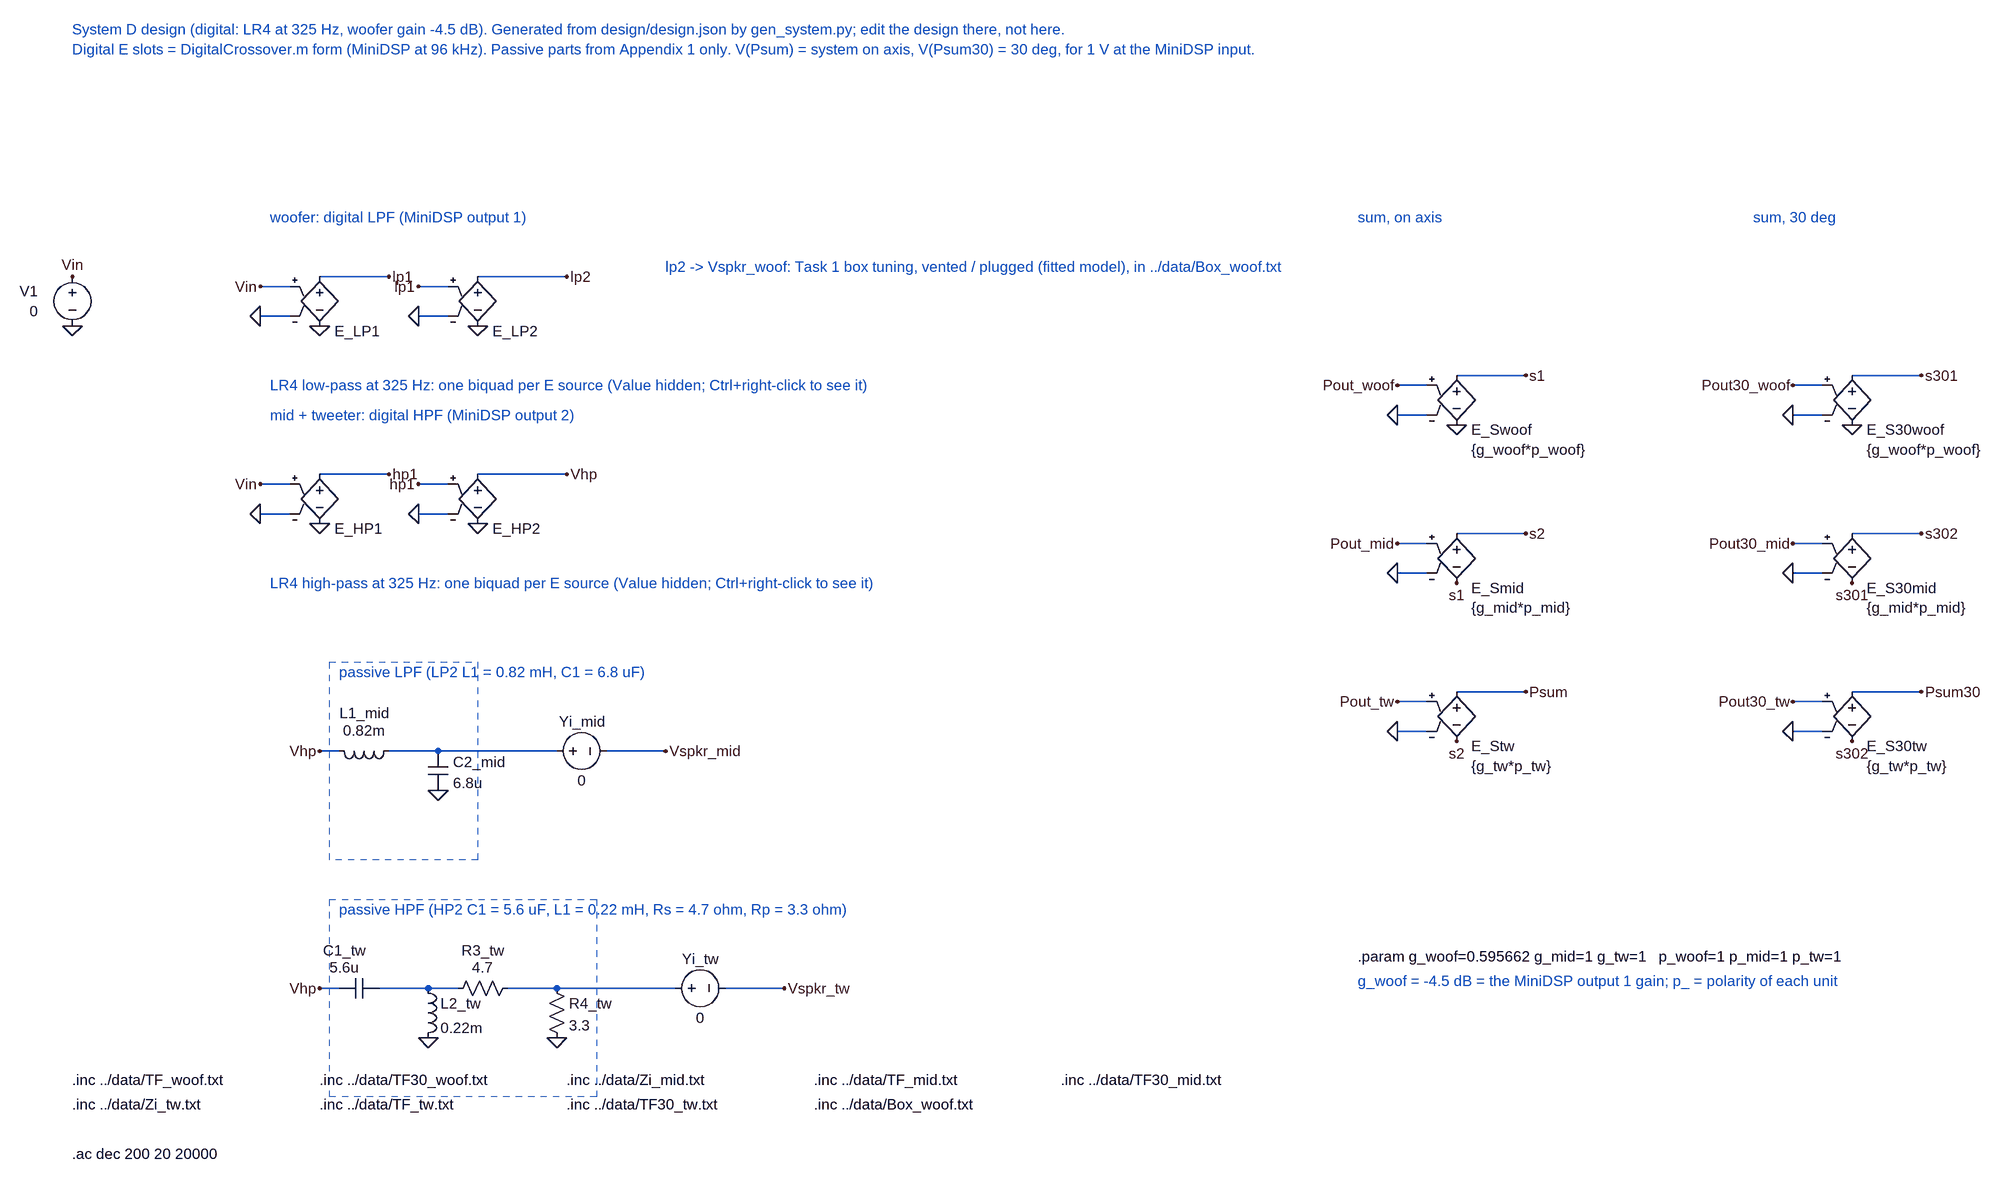
[diagram p0: schematic System_D_design.asc]
System_D_design.asc, the LTspice schematic file:
Version 4
SHEET 1 3200 1800
TEXT -400 -400 Left 2 ;System D design (digital: LR4 at 325 Hz, woofer gain -4.5 dB). Generated from design/design.json by gen_system.py; edit the design there, not here.
TEXT -400 -368 Left 2 ;Digital E slots = DigitalCrossover.m form (MiniDSP at 96 kHz). Passive parts from Appendix 1 only. V(Psum) = system on axis, V(Psum30) = 30 deg, for 1 V at the MiniDSP input.
SYMBOL voltage -400 -16 R0
WINDOW 0 -56 40 Right 2
WINDOW 3 -56 72 Right 2
SYMATTR InstName V1
SYMATTR Value 0
SYMATTR Value2 AC 1
FLAG -400 0 Vin
FLAG -400 80 0
TEXT -80 -96 Left 2 ;woofer: digital LPF (MiniDSP output 1)
SYMBOL e 0 -16 R0
WINDOW 0 24 104 Left 2
WINDOW 3 24 136 Invisible 2
SYMATTR InstName E_LP1
SYMATTR Value Laplace=(0.000111435745339139+0.000222871490678279*exp(-s*1.04166666666667e-05)+0.000111435745339139*exp(-2*s*1.04166666666667e-05))/(1+-1.96992019814112*exp(-s*1.04166666666667e-05)+0.970365941122475*exp(-2*s*1.04166666666667e-05))
FLAG 0 80 0
WIRE -48 16 -96 16
FLAG -96 16 Vin
WIRE -48 64 -96 64
FLAG -96 64 0
WIRE 0 0 112 0
FLAG 112 0 lp1
SYMBOL e 256 -16 R0
WINDOW 0 24 104 Left 2
WINDOW 3 24 136 Invisible 2
SYMATTR InstName E_LP2
SYMATTR Value Laplace=(0.000111435745339139+0.000222871490678279*exp(-s*1.04166666666667e-05)+0.000111435745339139*exp(-2*s*1.04166666666667e-05))/(1+-1.96992019814112*exp(-s*1.04166666666667e-05)+0.970365941122475*exp(-2*s*1.04166666666667e-05))
FLAG 256 80 0
WIRE 208 16 160 16
FLAG 160 16 lp1
WIRE 208 64 160 64
FLAG 160 64 0
WIRE 256 0 400 0
FLAG 400 0 lp2
TEXT -80 176 Left 2 ;LR4 low-pass at 325 Hz: one biquad per E source (Value hidden; Ctrl+right-click to see it)
TEXT -80 224 Left 2 ;mid + tweeter: digital HPF (MiniDSP output 2)
SYMBOL e 0 304 R0
WINDOW 0 24 104 Left 2
WINDOW 3 24 136 Invisible 2
SYMATTR InstName E_HP1
SYMATTR Value Laplace=(0.985071534815898+-1.9701430696318*exp(-s*1.04166666666667e-05)+0.985071534815898*exp(-2*s*1.04166666666667e-05))/(1+-1.96992019814112*exp(-s*1.04166666666667e-05)+0.970365941122475*exp(-2*s*1.04166666666667e-05))
FLAG 0 400 0
WIRE -48 336 -96 336
FLAG -96 336 Vin
WIRE -48 384 -96 384
FLAG -96 384 0
WIRE 0 320 112 320
FLAG 112 320 hp1
SYMBOL e 256 304 R0
WINDOW 0 24 104 Left 2
WINDOW 3 24 136 Invisible 2
SYMATTR InstName E_HP2
SYMATTR Value Laplace=(0.985071534815898+-1.9701430696318*exp(-s*1.04166666666667e-05)+0.985071534815898*exp(-2*s*1.04166666666667e-05))/(1+-1.96992019814112*exp(-s*1.04166666666667e-05)+0.970365941122475*exp(-2*s*1.04166666666667e-05))
FLAG 256 400 0
WIRE 208 336 160 336
FLAG 160 336 hp1
WIRE 208 384 160 384
FLAG 160 384 0
WIRE 256 320 400 320
FLAG 400 320 Vhp
TEXT -80 496 Left 2 ;LR4 high-pass at 325 Hz: one biquad per E source (Value hidden; Ctrl+right-click to see it)
TEXT 560 -16 Left 2 ;lp2 -> Vspkr_woof: Task 1 box tuning, vented / plugged (fitted model), in ../data/Box_woof.txt
RECTANGLE Normal 16 624 256 944 2
TEXT 32 640 Left 2 ;passive LPF (LP2 L1 = 0.82 mH, C1 = 6.8 uF)
SYMBOL voltage 368 768 R270
WINDOW 0 32 56 VTop 2
WINDOW 3 -32 56 VBottom 2
SYMATTR InstName Yi_mid
SYMATTR Value 0
RECTANGLE Normal 16 1008 448 1328 2
TEXT 32 1024 Left 2 ;passive HPF (HP2 C1 = 5.6 uF, L1 = 0.22 mH, Rs = 4.7 ohm, Rp = 3.3 ohm)
SYMBOL voltage 560 1152 R270
WINDOW 0 32 56 VTop 2
WINDOW 3 -32 56 VBottom 2
SYMATTR InstName Yi_tw
SYMATTR Value 0
WIRE 0 768 32 768
WIRE 112 768 144 768
WIRE 144 768 192 768
WIRE 192 768 240 768
WIRE 240 768 304 768
WIRE 304 768 384 768
WIRE 464 768 560 768
WIRE 0 1152 32 1152
WIRE 96 1152 128 1152
WIRE 128 1152 176 1152
WIRE 176 1152 224 1152
WIRE 304 1152 336 1152
WIRE 336 1152 384 1152
WIRE 384 1152 432 1152
WIRE 432 1152 496 1152
WIRE 496 1152 576 1152
WIRE 656 1152 752 1152
FLAG 0 768 Vhp
FLAG 192 832 0
FLAG 560 768 Vspkr_mid
FLAG 0 1152 Vhp
FLAG 176 1232 0
FLAG 384 1232 0
FLAG 752 1152 Vspkr_tw
SYMBOL ind 128 752 R90
WINDOW 0 -30 56 VBottom 2
WINDOW 3 -2 56 VBottom 2
SYMATTR InstName L1_mid
SYMATTR Value 0.82m
SYMATTR SpiceLine Rser=0
SYMBOL cap 176 768 R0
WINDOW 0 40 18 Left 2
WINDOW 3 40 52 Left 2
SYMATTR InstName C2_mid
SYMATTR Value 6.8u
SYMBOL cap 96 1136 R90
WINDOW 0 -30 56 VBottom 2
WINDOW 3 -2 56 VBottom 2
SYMATTR InstName C1_tw
SYMATTR Value 5.6u
SYMBOL ind 160 1136 R0
SYMATTR InstName L2_tw
SYMATTR Value 0.22m
SYMATTR SpiceLine Rser=0
SYMBOL res 320 1136 R90
WINDOW 0 -30 56 VBottom 2
WINDOW 3 -2 56 VBottom 2
SYMATTR InstName R3_tw
SYMATTR Value 4.7
SYMBOL res 368 1136 R0
SYMATTR InstName R4_tw
SYMATTR Value 3.3
TEXT 1680 -96 Left 2 ;sum, on axis
SYMBOL e 1840 144 R0
WINDOW 0 24 104 Left 2
WINDOW 3 24 136 Left 2
SYMATTR InstName E_Swoof
SYMATTR Value {g_woof*p_woof}
FLAG 1840 240 0
WIRE 1792 176 1744 176
FLAG 1744 176 Pout_woof
WIRE 1792 224 1744 224
FLAG 1744 224 0
WIRE 1840 160 1952 160
FLAG 1952 160 s1
SYMBOL e 1840 400 R0
WINDOW 0 24 104 Left 2
WINDOW 3 24 136 Left 2
SYMATTR InstName E_Smid
SYMATTR Value {g_mid*p_mid}
FLAG 1840 496 s1
WIRE 1792 432 1744 432
FLAG 1744 432 Pout_mid
WIRE 1792 480 1744 480
FLAG 1744 480 0
WIRE 1840 416 1952 416
FLAG 1952 416 s2
SYMBOL e 1840 656 R0
WINDOW 0 24 104 Left 2
WINDOW 3 24 136 Left 2
SYMATTR InstName E_Stw
SYMATTR Value {g_tw*p_tw}
FLAG 1840 752 s2
WIRE 1792 688 1744 688
FLAG 1744 688 Pout_tw
WIRE 1792 736 1744 736
FLAG 1744 736 0
WIRE 1840 672 1952 672
FLAG 1952 672 Psum
TEXT 2320 -96 Left 2 ;sum, 30 deg
SYMBOL e 2480 144 R0
WINDOW 0 24 104 Left 2
WINDOW 3 24 136 Left 2
SYMATTR InstName E_S30woof
SYMATTR Value {g_woof*p_woof}
FLAG 2480 240 0
WIRE 2432 176 2384 176
FLAG 2384 176 Pout30_woof
WIRE 2432 224 2384 224
FLAG 2384 224 0
WIRE 2480 160 2592 160
FLAG 2592 160 s301
SYMBOL e 2480 400 R0
WINDOW 0 24 104 Left 2
WINDOW 3 24 136 Left 2
SYMATTR InstName E_S30mid
SYMATTR Value {g_mid*p_mid}
FLAG 2480 496 s301
WIRE 2432 432 2384 432
FLAG 2384 432 Pout30_mid
WIRE 2432 480 2384 480
FLAG 2384 480 0
WIRE 2480 416 2592 416
FLAG 2592 416 s302
SYMBOL e 2480 656 R0
WINDOW 0 24 104 Left 2
WINDOW 3 24 136 Left 2
SYMATTR InstName E_S30tw
SYMATTR Value {g_tw*p_tw}
FLAG 2480 752 s302
WIRE 2432 688 2384 688
FLAG 2384 688 Pout30_tw
WIRE 2432 736 2384 736
FLAG 2384 736 0
WIRE 2480 672 2592 672
FLAG 2592 672 Psum30
TEXT 1680 1100 Left 2 !.param g_woof=0.595662 g_mid=1 g_tw=1   p_woof=1 p_mid=1 p_tw=1
TEXT 1680 1140 Left 2 ;g_woof = -4.5 dB = the MiniDSP output 1 gain; p_ = polarity of each unit
TEXT -400 1300 Left 2 !.inc ../data/TF_woof.txt
TEXT 0 1300 Left 2 !.inc ../data/TF30_woof.txt
TEXT 400 1300 Left 2 !.inc ../data/Zi_mid.txt
TEXT 800 1300 Left 2 !.inc ../data/TF_mid.txt
TEXT 1200 1300 Left 2 !.inc ../data/TF30_mid.txt
TEXT -400 1340 Left 2 !.inc ../data/Zi_tw.txt
TEXT 0 1340 Left 2 !.inc ../data/TF_tw.txt
TEXT 400 1340 Left 2 !.inc ../data/TF30_tw.txt
TEXT 800 1340 Left 2 !.inc ../data/Box_woof.txt
TEXT -400 1420 Left 2 !.ac dec 200 20 20000

The netlist it stands for:
* System_D_design.asc
V1 Vin 0 0 AC 1
E_LP1 lp1 0 Vin 0 Laplace=(0.000111435745339139+0.000222871490678279*exp(-s*1.04166666666667e-05)+0.000111435745339139*exp(-2*s*1.04166666666667e-05))/(1+-1.96992019814112*exp(-s*1.04166666666667e-05)+0.970365941122475*exp(-2*s*1.04166666666667e-05))
E_LP2 lp2 0 lp1 0 Laplace=(0.000111435745339139+0.000222871490678279*exp(-s*1.04166666666667e-05)+0.000111435745339139*exp(-2*s*1.04166666666667e-05))/(1+-1.96992019814112*exp(-s*1.04166666666667e-05)+0.970365941122475*exp(-2*s*1.04166666666667e-05))
E_HP1 hp1 0 Vin 0 Laplace=(0.985071534815898+-1.9701430696318*exp(-s*1.04166666666667e-05)+0.985071534815898*exp(-2*s*1.04166666666667e-05))/(1+-1.96992019814112*exp(-s*1.04166666666667e-05)+0.970365941122475*exp(-2*s*1.04166666666667e-05))
E_HP2 Vhp 0 hp1 0 Laplace=(0.985071534815898+-1.9701430696318*exp(-s*1.04166666666667e-05)+0.985071534815898*exp(-2*s*1.04166666666667e-05))/(1+-1.96992019814112*exp(-s*1.04166666666667e-05)+0.970365941122475*exp(-2*s*1.04166666666667e-05))
V§Yi_mid N001 Vspkr_mid 0
V§Yi_tw N003 Vspkr_tw 0
L1_mid N001 Vhp 0.82m Rser=0
C2_mid N001 0 6.8u
C1_tw N002 Vhp 5.6u
L2_tw N002 0 0.22m Rser=0
R3_tw N003 N002 4.7
R4_tw N003 0 3.3
E_Swoof s1 0 Pout_woof 0 {g_woof*p_woof}
E_Smid s2 s1 Pout_mid 0 {g_mid*p_mid}
E_Stw Psum s2 Pout_tw 0 {g_tw*p_tw}
E_S30woof s301 0 Pout30_woof 0 {g_woof*p_woof}
E_S30mid s302 s301 Pout30_mid 0 {g_mid*p_mid}
E_S30tw Psum30 s302 Pout30_tw 0 {g_tw*p_tw}
* System D design (digital: LR4 at 325 Hz, woofer gain -4.5 dB). Generated from design/design.json by gen_system.py; edit the design there, not here.
* Digital E slots = DigitalCrossover.m form (MiniDSP at 96 kHz). Passive parts from Appendix 1 only. V(Psum) = system on axis, V(Psum30) = 30 deg, for 1 V at the MiniDSP input.
* woofer: digital LPF (MiniDSP output 1)
* LR4 low-pass at 325 Hz: one biquad per E source (Value hidden; Ctrl+right-click to see it)
* mid + tweeter: digital HPF (MiniDSP output 2)
* LR4 high-pass at 325 Hz: one biquad per E source (Value hidden; Ctrl+right-click to see it)
* lp2 -> Vspkr_woof: Task 1 box tuning, vented / plugged (fitted model), in ../data/Box_woof.txt
* passive LPF (LP2 L1 = 0.82 mH, C1 = 6.8 uF)
* passive HPF (HP2 C1 = 5.6 uF, L1 = 0.22 mH, Rs = 4.7 ohm, Rp = 3.3 ohm)
* sum, on axis
* sum, 30 deg
.param g_woof=0.595662 g_mid=1 g_tw=1   p_woof=1 p_mid=1 p_tw=1
* g_woof = -4.5 dB = the MiniDSP output 1 gain; p_ = polarity of each unit
.inc ../data/TF_woof.txt
.inc ../data/TF30_woof.txt
.inc ../data/Zi_mid.txt
.inc ../data/TF_mid.txt
.inc ../data/TF30_mid.txt
.inc ../data/Zi_tw.txt
.inc ../data/TF_tw.txt
.inc ../data/TF30_tw.txt
.inc ../data/Box_woof.txt
.ac dec 200 20 20000
.backanno
.end